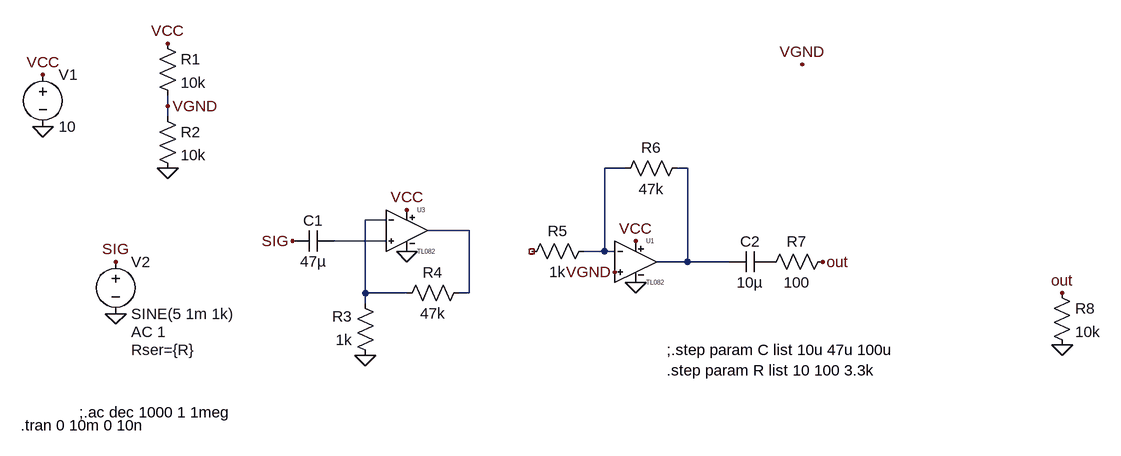
[diagram p0: schematic microphone_opamp_amplifier2.asc]
microphone_opamp_amplifier2.asc, the LTspice schematic file:
Version 4
SHEET 1 1416 680
WIRE -64 -16 -64 -32
WIRE -64 0 -64 -16
WIRE 640 80 608 80
WIRE 736 80 720 80
WIRE 272 160 240 160
WIRE 400 176 336 176
WIRE 272 192 192 192
WIRE 608 208 608 80
WIRE 608 208 576 208
WIRE 624 208 608 208
WIRE 736 224 736 80
WIRE 736 224 688 224
WIRE 800 224 736 224
WIRE 240 272 240 160
WIRE 304 272 240 272
WIRE 400 272 400 176
WIRE 400 272 384 272
WIRE 240 288 240 272
FLAG -256 16 0
FLAG -256 -64 VCC
FLAG -64 80 0
FLAG -64 -112 VCC
FLAG -64 -16 VGND
FLAG 304 144 VCC
FLAG 656 192 VCC
FLAG 304 208 0
FLAG 656 256 0
FLAG 912 -80 VGND
FLAG 624 240 VGND
FLAG -144 304 0
FLAG -144 224 SIG
FLAG 944 224 out
FLAG 128 192 SIG
FLAG 1312 352 0
FLAG 1312 272 out
FLAG 240 368 0
SYMBOL voltage -256 -80 R0
WINDOW 123 0 0 Left 0
WINDOW 39 0 0 Left 0
SYMATTR InstName V1
SYMATTR Value 10
SYMBOL res -80 -128 R0
SYMATTR InstName R1
SYMATTR Value 10k
SYMBOL res -80 -16 R0
SYMATTR InstName R2
SYMATTR Value 10k
SYMBOL voltage -144 208 R0
WINDOW 123 24 124 Left 2
WINDOW 39 24 152 Left 2
SYMATTR Value2 AC 1
SYMATTR SpiceLine Rser={R}
SYMATTR InstName V2
SYMATTR Value SINE(5 1m 1k)
SYMBOL cap 192 176 R90
WINDOW 0 0 32 VBottom 2
WINDOW 3 32 32 VTop 2
SYMATTR InstName C1
SYMATTR Value 47µ
SYMBOL res 400 256 R90
WINDOW 0 0 56 VBottom 2
WINDOW 3 32 56 VTop 2
SYMATTR InstName R4
SYMATTR Value 47k
SYMBOL res 592 192 R90
WINDOW 0 0 56 VBottom 2
WINDOW 3 32 56 VTop 2
SYMATTR InstName R5
SYMATTR Value 1k
SYMBOL res 736 64 R90
WINDOW 0 0 56 VBottom 2
WINDOW 3 32 56 VTop 2
SYMATTR InstName R6
SYMATTR Value 47k
SYMBOL res 960 208 R90
WINDOW 0 0 56 VBottom 2
WINDOW 3 32 56 VTop 2
SYMATTR InstName R7
SYMATTR Value 100
SYMBOL cap 864 208 R90
WINDOW 0 0 32 VBottom 2
WINDOW 3 32 32 VTop 2
SYMATTR InstName C2
SYMATTR Value 10µ
SYMBOL res 1296 256 R0
SYMATTR InstName R8
SYMATTR Value 10k
SYMBOL my\\TL082 304 112 R0
SYMATTR InstName U3
SYMBOL my\\TL082 656 160 R0
SYMATTR InstName U1
SYMBOL res 256 384 R180
WINDOW 0 36 76 Left 2
WINDOW 3 36 40 Left 2
SYMATTR InstName R3
SYMATTR Value 1k
TEXT -200 456 Left 2 !;.ac dec 1000 1 1meg
TEXT 704 360 Left 2 !;.step param C list 10u 47u 100u\n.step param R list 10 100 3.3k
TEXT -290 476 Left 2 !.tran 0 10m 0 10n

The netlist it stands for:
* microphone_opamp_amplifier2.asc
V1 VCC 0 10
R1 VCC VGND 10k
R2 VGND 0 10k
V2 SIG 0 SINE(5 1m 1k) AC 1 Rser={R}
C1 N005 SIG 47µ
R4 N004 N003 47k
R5 N001 NC_01 1k
R6 N002 N001 47k
R7 out P001 100
C2 P001 N002 10µ
R8 out 0 10k
XU3 N005 N003 VCC 0 N004 TL082  ; pins IN+ IN- VCC VEE OUT
XU1 VGND N001 VCC 0 N002 TL082  ; pins IN+ IN- VCC VEE OUT
R3 0 N003 1k
;.ac dec 1000 1 1meg
;.step param C list 10u 47u 100u
.step param R list 10 100 3.3k
.tran 0 10m 0 10n
.lib TL082.sub
.backanno
.end